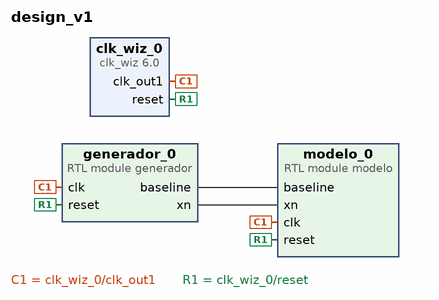
[diagram p0: block diagram of the top level]
# Vivado block design design_v1, xc7a35tcpg236-1, Vivado 2024.1
create_bd_design design_v1

create_bd_cell -type module -reference modelo modelo_0
create_bd_cell -type module -reference generador generador_0
create_bd_cell -type ip -vlnv xilinx.com:ip:clk_wiz:6.0 clk_wiz_0
set_property -dict [list \
  CONFIG.CLKOUT1_JITTER 144.481 \
  CONFIG.CLKOUT1_REQUESTED_OUT_FREQ 62.5 \
  CONFIG.CLK_IN1_BOARD_INTERFACE sys_clock \
  CONFIG.MMCM_CLKOUT0_DIVIDE_F 16.000 \
  CONFIG.USE_LOCKED false \
] [get_bd_cells clk_wiz_0]

# ---- connections ----

connect_bd_net [get_bd_pins clk_wiz_0/clk_out1] [get_bd_pins generador_0/clk] [get_bd_pins modelo_0/clk]
connect_bd_net [get_bd_pins generador_0/baseline] [get_bd_pins modelo_0/baseline]
connect_bd_net [get_bd_pins generador_0/xn] [get_bd_pins modelo_0/xn]
connect_bd_net -net reset_0_1 [get_bd_pins clk_wiz_0/reset] [get_bd_pins modelo_0/reset] [get_bd_pins generador_0/reset]

validate_bd_design
save_bd_design
